# Altium schematic sheet 1.power.SchDoc
size A4; Organization: ORGANIZATION; Address1: ADDRESS 1; Address2: ADDRESS 2; Address3: ADDRESS 3; Address4: ADDRESS 4; DocumentNumber: 2; SheetNumber: 2; SheetTotal: 5; ENG_APP_DATE: --/--/--; DSN_APP_DATE: --/--/--; CHK_APP_DATE: --/--/--; Page: Power Section
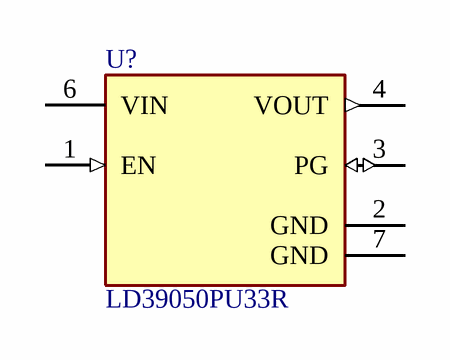
[diagram p0: 1.power.SchDoc]

## Parts
U?  LD39050PU33R  [SON95P300X300X100-7N]

## Nets

Not connected (* = marked no-connect by the designer): U? 1(EN) 2(GND) 3(PG) 4(VOUT) 6(VIN) 7(GND)

## Notes on the sheet
- Title :
- Size:
- Date:
- Page :
- A4
- Number:
- Time:
- Revision:
- Sheet
- of
- Sheet Name :
- Drawn By :

## Library data of the parts
U? = LD39050PU33R: Linear Voltage Regulator IC Positive Fixed 1 Output 500mA 6-DFN (3x3); MF: STMicroelectronics; SnapEDA_Link: https://www.snapeda.com/parts/LD39050PU33R/STMicroelectronics/view-part/?ref=snap; Package: DFN-6 STMicroelectronics; Value: *; MP: LD39050PU33R; Check_prices: https://www.snapeda.com/parts/LD39050PU33R/STMicroelectronics/view-part/?ref=eda